# Altium project Analizador_trifasico_IoT_pcb.PrjPcb (part 2 of 2)
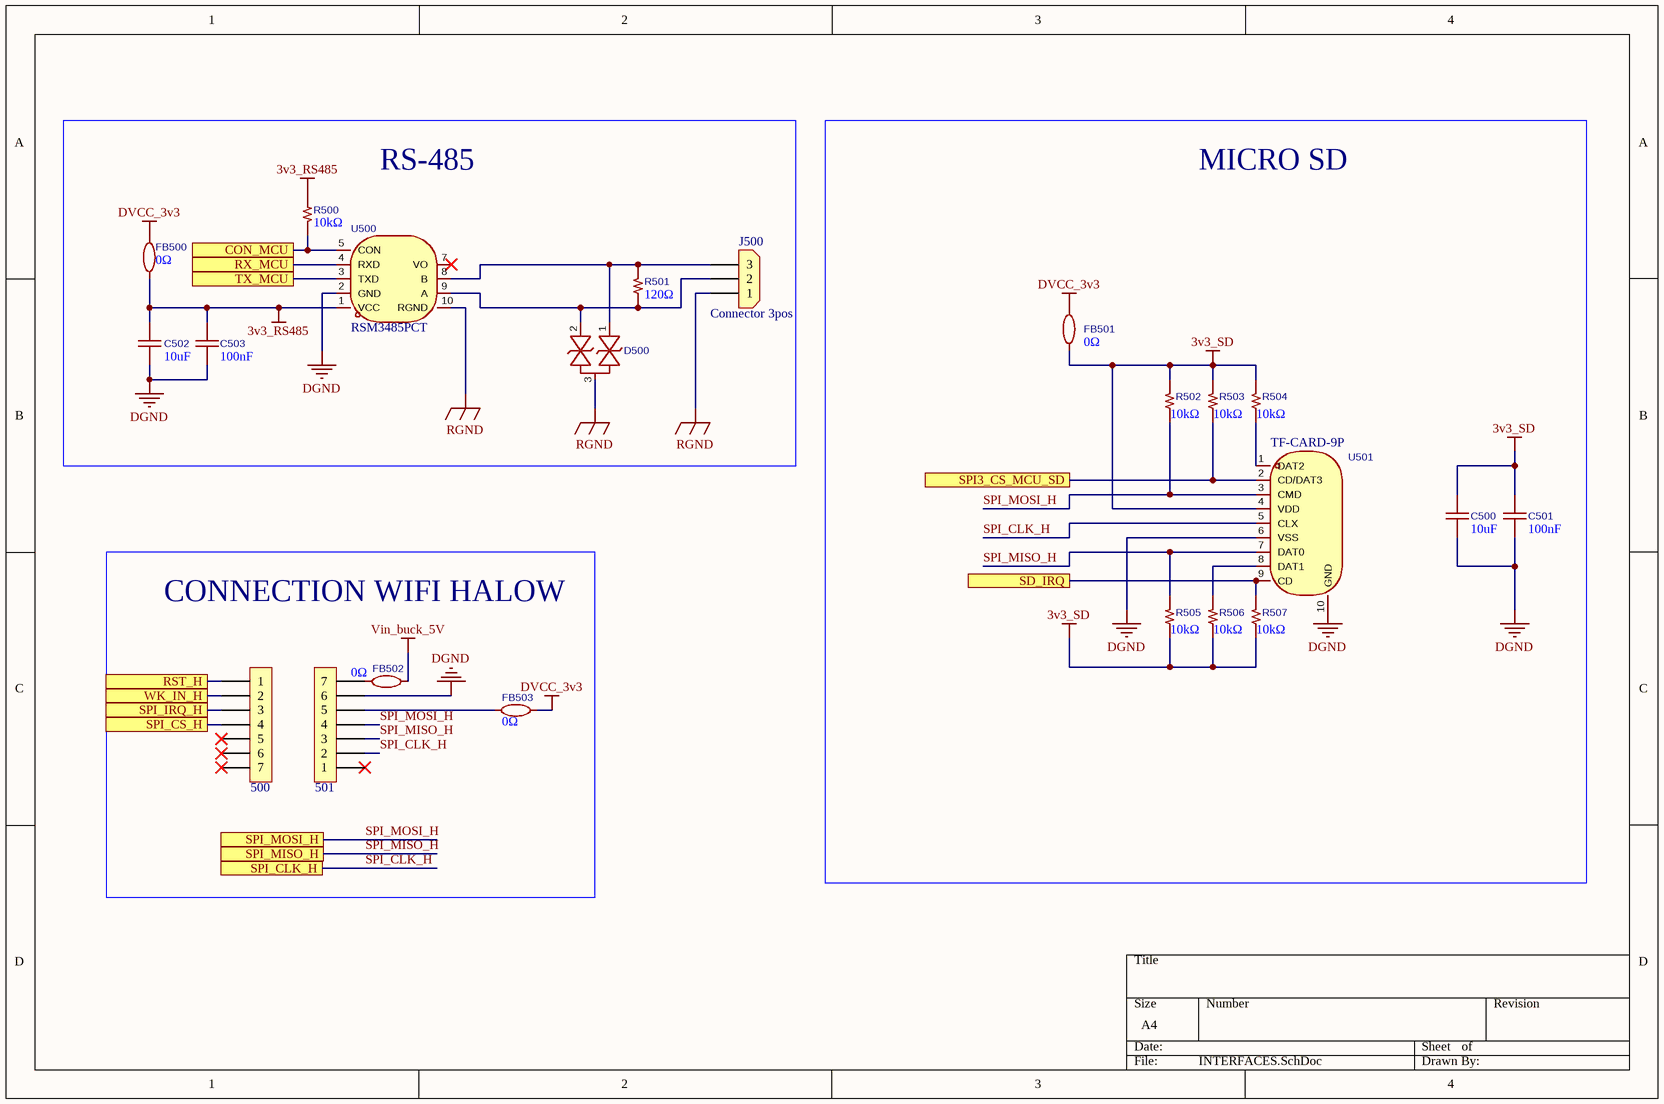
[diagram p6: INTERFACES.SchDoc]

## Nets that join several sheets
3v3_MCU: MEASURES (C113.2 R101.2 U101.1), MCU (6 pins)
5V_USB: POWER (200.1), MCU (j400.A4/B9 j400.B4/A9 U400.5)
AGND: MEASURES (21 pins), POWER (5 pins), THREE PHASES (32 pins)
AVCC_3v3: MEASURES (FB100.2), POWER (C209.2 D203.1 R203.2 U202.4)
DGND: MEASURES (C113.1 U101.2 U101.8), POWER (11 pins), MCU (15 pins), INTERFACES (8 pins)
DVCC_3v3: POWER (C200.2 D204.1 L200.2 U200.4), MCU (FB400.2), INTERFACES (FB500.2 FB501.2 FB503.1)
Vin_buck_5V: POWER (6 pins), INTERFACES (FB502.1)
L3_120VAC: POWER (PS200.1), THREE PHASES (F302.2 R326.2 RV302.1)
Net500_1: MCU (U401.5), INTERFACES (500.1)
Net500_2: MCU (U401.6), INTERFACES (500.2)
Net500_3: MCU (U401.7), INTERFACES (500.3)
Net500_4: MCU (U401.18), INTERFACES (500.4)
NetC300_2: MEASURES (U100.4), THREE PHASES (C300.2 R300.1)
NetC301_1: MEASURES (U100.5), THREE PHASES (C301.1 R309.1)
NetC302_2: MEASURES (U100.12), THREE PHASES (C302.2 R308.1 R310.2)
NetC303_1: MEASURES (U100.13), THREE PHASES (C303.1 R312.1)
NetC304_2: MEASURES (U100.7), THREE PHASES (C304.2 R311.1)
NetC305_1: MEASURES (U100.8), THREE PHASES (C305.1 R322.1)
NetC306_2: MEASURES (U100.14), THREE PHASES (C306.2 R319.1 R320.2)
NetC307_1: MEASURES (U100.15), THREE PHASES (C307.1 R323.1)
NetC308_2: MEASURES (U100.10), THREE PHASES (C308.2 R324.1)
NetC309_2: MEASURES (U100.16), THREE PHASES (C309.2 R331.1 R332.2)
NetC310_1: MEASURES (U100.11), THREE PHASES (C310.1 R334.1)
NetC311_1: MEASURES (U100.17), THREE PHASES (C311.1 R335.1)
NetC312_2: MEASURES (U100.18), THREE PHASES (C312.2 R336.1)
NetC313_1: MEASURES (U100.19), THREE PHASES (C313.1 R339.1)
NetR500_2: MCU (U401.9), INTERFACES (R500.2 U500.5)
NetR503_1: MCU (U401.31), INTERFACES (R503.1 U501.2)
NetR507_2: MCU (U401.17), INTERFACES (R507.2 U501.9)
NetU101_3: MEASURES (U101.3), MCU (U401.22)
NetU101_4: MEASURES (U101.4), MCU (U401.23)
NetU101_5: MEASURES (U101.5), MCU (U401.24)
NetU101_6: MEASURES (U101.6), MCU (U401.25)
NetU401_10: MCU (U401.10), INTERFACES (U500.3)
NetU401_11: MCU (U401.11), INTERFACES (U500.4)
SPI_CLK_H: MCU (U401.20), INTERFACES (501.2 U501.5)
SPI_MISO_H: MCU (U401.21), INTERFACES (501.3 R505.2 U501.7)
SPI_MOSI_H: MCU (U401.19), INTERFACES (501.4 R502.1 U501.3)